# Altium schematic sheet Top_Sheet.SchDoc
size A4; DocumentNumber: 1; SheetNumber: 1; SheetTotal: 7
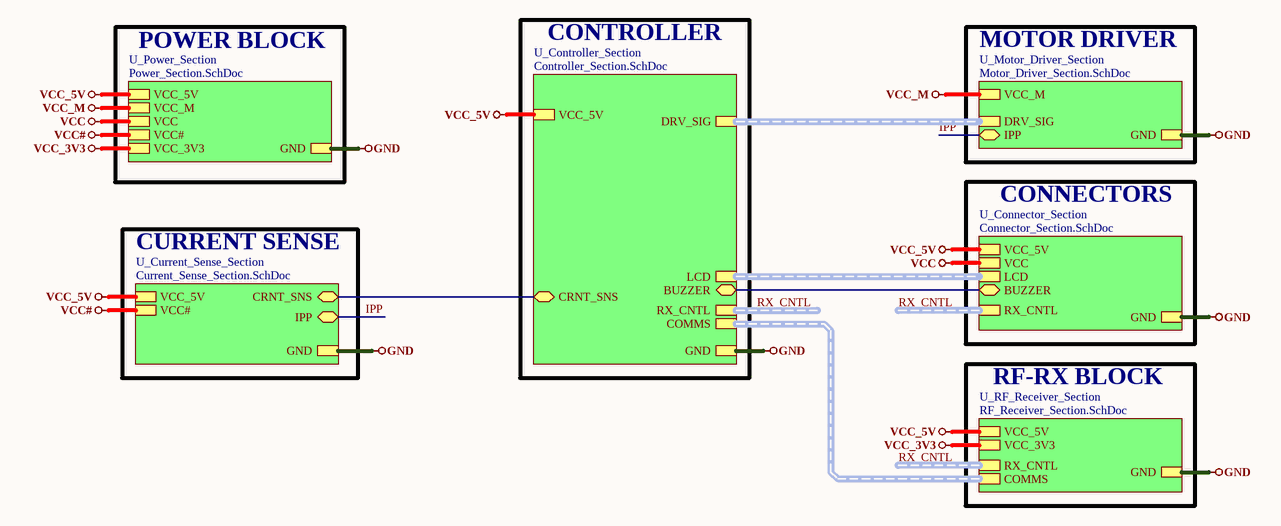
[diagram p0: Top_Sheet.SchDoc]

## Sub-sheets
U_Connector_Section = Connector_Section.SchDoc: RX_CNTL (harness RX_CNTRL), BUZZER (bidir), LCD (harness LCD), GND, VCC_5V, VCC
U_Controller_Section = Controller_Section.SchDoc: BUZZER (bidir), GND, VCC_5V, CRNT_SNS (bidir), RX_CNTL (harness RX_CNTRL), DRV_SIG (harness DRV_SIG), LCD (harness LCD), COMMS (harness COMMS)
U_Current_Sense_Section = Current_Sense_Section.SchDoc: CRNT_SNS (bidir), IPP (bidir), GND, VCC_5V, VCC#
U_Motor_Driver_Section = Motor_Driver_Section.SchDoc: DRV_SIG (harness DRV_SIG), IPP (bidir), GND, VCC_M
U_Power_Section = Power_Section.SchDoc: GND, VCC_5V, VCC_M, VCC#, VCC, VCC_3V3
U_RF_Receiver_Section = RF_Receiver_Section.SchDoc: GND, VCC_5V, VCC_3V3, COMMS (harness COMMS), RX_CNTL (harness RX_CNTRL)

## Nets
GND: sheet U_Motor_Driver_Section/GND, sheet U_Connector_Section/GND, sheet U_Power_Section/GND, sheet U_Controller_Section/GND, sheet U_Current_Sense_Section/GND, sheet U_RF_Receiver_Section/GND
VCC: sheet U_Connector_Section/VCC, sheet U_Power_Section/VCC
VCC#: sheet U_Power_Section/VCC#, sheet U_Current_Sense_Section/VCC#
VCC_3V3: sheet U_Power_Section/VCC_3V3, sheet U_RF_Receiver_Section/VCC_3V3
VCC_5V: sheet U_Connector_Section/VCC_5V, sheet U_Power_Section/VCC_5V, sheet U_Controller_Section/VCC_5V, sheet U_Current_Sense_Section/VCC_5V, sheet U_RF_Receiver_Section/VCC_5V
VCC_M: sheet U_Motor_Driver_Section/VCC_M, sheet U_Power_Section/VCC_M
IPP: sheet U_Motor_Driver_Section/IPP, sheet U_Current_Sense_Section/IPP
(unnamed): sheet U_Connector_Section/BUZZER, sheet U_Controller_Section/BUZZER
(unnamed): sheet U_Controller_Section/CRNT_SNS, sheet U_Current_Sense_Section/CRNT_SNS

## Buses and harness runs
harness RX_CNTL = sheet U_Connector_Section/RX_CNTL
harness RX_CNTL = sheet U_Controller_Section/RX_CNTL
harness RX_CNTL = sheet U_RF_Receiver_Section/RX_CNTL
harness sheet U_Connector_Section/LCD = sheet U_Controller_Section/LCD
harness sheet U_Controller_Section/COMMS = sheet U_RF_Receiver_Section/COMMS
harness sheet U_Controller_Section/DRV_SIG = sheet U_Motor_Driver_Section/DRV_SIG

## Notes on the sheet
- POWER BLOCK
- CONTROLLER
- MOTOR DRIVER
- CURRENT SENSE
- CONNECTORS
- RF-RX BLOCK
- 1
- Huzaifa Ali